# Altium schematic sheet Sensor_Section.SchDoc
size A; DocumentNumber: 9; SheetNumber: 9; SheetTotal: 13
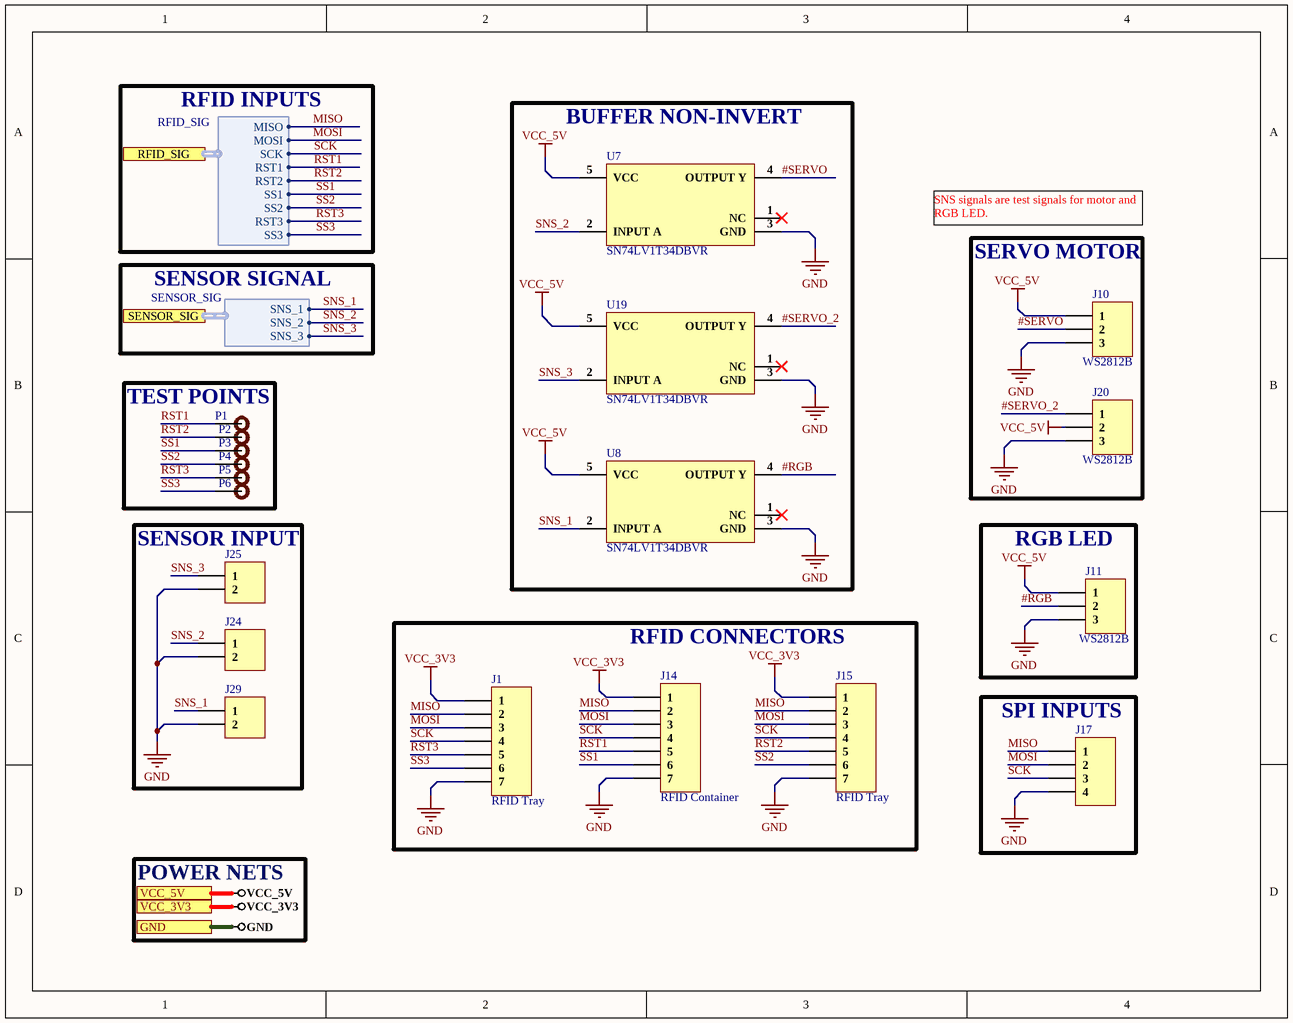
[diagram p0: Sensor_Section.SchDoc]

## Parts
J1  RFID Tray  [B7B-XH-A(LF)(SN)]
J10  WS2812B  [B3B-XH-A(LF)(SN)]
J11  WS2812B  [B3B-XH-A(LF)(SN)]
J14  RFID Container  [B7B-XH-A(LF)(SN)]
J15  RFID Tray  [B7B-XH-A(LF)(SN)]
J17  B4B-XH-A(LF)(SN)  [B4B-XH-A(LF)(SN)]  (value not drawn)
J20  WS2812B  [B3B-XH-A(LF)(SN)]
J24  B2B-XH-A(LF)(SN)  [B2B-XH-A(LF)(SN)]  (value not drawn)
J25  B2B-XH-A(LF)(SN)  [B2B-XH-A(LF)(SN)]  (value not drawn)
J29  B2B-XH-A(LF)(SN)  [B2B-XH-A(LF)(SN)]  (value not drawn)
P1  Test Point  [Test point]  (value not drawn)
P2  Test Point  [Test point]  (value not drawn)
P3  Test Point  [Test point]  (value not drawn)
P4  Test Point  [Test point]  (value not drawn)
P5  Test Point  [Test point]  (value not drawn)
P6  Test Point  [Test point]  (value not drawn)
U7  SN74LV1T34DBVR  [SOT-23-5]
U8  SN74LV1T34DBVR  [SOT-23-5]
U19  SN74LV1T34DBVR  [SOT-23-5]

## Blocks framed on the sheet
BUFFER NON-INVERT: U7 U8 U19
SERVO MOTOR: J10 J20
TEST POINTS: P1-P6
SENSOR INPUT: J24 J25 J29
RGB LED: J11
RFID CONNECTORS: J1 J14 J15
SPI INPUTS: J17

## Ports
GND, RFID_SIG (harness RFID_SIG), SENSOR_SIG (harness SENSOR_SIG), VCC_3V3, VCC_5V

## Harnesses
SENSOR_SIG: SNS_1, SNS_2, SNS_3
RFID_SIG: MOSI, SCK, RST1, MISO, RST2, SS1, SS2, SS3, RST3

## Nets
GND: J1.7 J10.3 J11.3 J14.7 J15.7 J17.4 J20.3 J24.2 J25.2 J29.2 U7.3(GND) U8.3(GND) U19.3(GND) ; port GND
VCC_3V3: J1.1 J14.1 J15.1 ; port VCC_3V3
VCC_5V: J10.1 J11.1 J20.2 U7.5(VCC) U8.5(VCC) U19.5(VCC) ; port VCC_5V
#RGB: J11.2 U8.4(OUTPUT_Y)
#SERVO: J10.2 U7.4(OUTPUT_Y)
#SERVO_2: J20.1 U19.4(OUTPUT_Y)
MISO: J1.2 J14.2 J15.2 J17.1 ; port RFID_SIG.MISO
MOSI: J1.3 J14.3 J15.3 J17.2 ; port RFID_SIG.MOSI
RST1: J14.5 P1.1 ; port RFID_SIG.RST1
RST2: J15.5 P2.1 ; port RFID_SIG.RST2
RST3: J1.5 P5.1 ; port RFID_SIG.RST3
SCK: J1.4 J14.4 J15.4 J17.3 ; port RFID_SIG.SCK
SNS_1: J29.1 U8.2(INPUT_A) ; port SENSOR_SIG.SNS_1
SNS_2: J24.1 U7.2(INPUT_A) ; port SENSOR_SIG.SNS_2
SNS_3: J25.1 U19.2(INPUT_A) ; port SENSOR_SIG.SNS_3
SS1: J14.6 P3.1 ; port RFID_SIG.SS1
SS2: J15.6 P4.1 ; port RFID_SIG.SS2
SS3: J1.6 P6.1 ; port RFID_SIG.SS3

Not connected (* = marked no-connect by the designer): U7 1(NC)*; U8 1(NC)*; U19 1(NC)*

## Notes on the sheet
- RFID INPUTS
- SNS signals are test signals for motor and RGB LED.
- SENSOR SIGNAL
- POWER NETS

## Library data of the parts
J1 J14 J15 = B7B-XH-A(LF)(SN): CONN HEADER VERT 7POS 2.5MM; Manufacturer: JST; Current Rating: 3A; Number of Positions: 7; Contact Resistance: 20mR; Voltage Rating (AC): 250V; Insulation Resistance: 1GR; Wire/Cable Gauge: 22AWG; Supplier 1: Digi-Key; Manufacturer Part Number: B7B-XH-A(LF)(SN); Stock 1: 0; Mount: Through Hole; Contact Plating: Copper,Tin,Lead; Contact Material: Brass; Color: Natural; Housing Color: White; Housing Material: Polyamide; Contact Shape: Square; Insulation Material: Nylon; Insulation Color: Natural; Contact Finish - Mating: TIN; Min Operating Temperature: -25°C; Max Operating Temperature: 85°C; Number of Rows: 1; Packaging: Bulk; Termination: Solder; Connector Type: Header; Series: XH; Contact Type: Male Pin; Voltage Rating: 250V; Max Current Rating: 3A; Fastening Type: Detent; Number of Contacts: 7; Max Voltage Rating (AC): 250V; Orientation: Straight; Length: 19.9mm; Pitch: 2.5mm; Lead Pitch: 2.5mm; Depth: 5.75mm; REACH SVHC: No SVHC; Lead Free: Lead Free; Flammability Rating: UL94 V-0; ComponentLink1URL: https://www.verical.com/server-webapp/html/getDatasheet?partID=440406&src-supplier=Verical; ComponentLink1Description: https://www.verical.com/server-webapp/html/getDatasheet?partID=440406&src-supplier=Verical; Supplier Part Number 1: 455-2252-ND
J10 J11 J20 = B3B-XH-A(LF)(SN): CONN HEADER VERT 3POS 2.5MM; Manufacturer: JST; Current Rating: 3A; Number of Positions: 3; Voltage Rating (AC): 250V; Contact Resistance: 20mR; Insulation Resistance: 1GR; Gender: Male; Wire/Cable Gauge: 22AWG; Supplier 1: Digi-Key; Manufacturer Part Number: B3B-XH-A(LF)(SN); Stock 1: 3453; Pricing 1: 1=0.19, 10=0.181, 25=0.1344, 50=0.1154, 250=0.09612, 750=0.08652, 1000=0.08075, 12000=0.06152, 24000=0.05575 (USD); Mount: Through Hole; Contact Plating: Tin,Lead,Copper; Contact Material: Brass; Color: Natural; Housing Color: White; Housing Material: Polyamide; Contact Shape: Square; Contact Finish - Mating: TIN; Insulation Material: Nylon; Insulation Color: Natural; Min Operating Temperature: -25°C; Max Operating Temperature: 85°C; Number of Rows: 1; Packaging: Bulk; Termination: Solder; Connector Type: Header; Series: XH; Contact Type: Male Pin; Max Current Rating: 3A; Voltage Rating: 250V; Fastening Type: Detent; Number of Contacts: 3; Max Voltage Rating (AC): 250V; Max Voltage Rating (DC): 250V; Orientation: Straight; Length: 9.9mm; Pitch: 2.5mm; Lead Pitch: 2.5mm; Depth: 5.75mm; Lead Free: Lead Free; REACH SVHC: No SVHC; Flammability Rating: UL94 V-0; ComponentLink1URL: https://www.verical.com/server-webapp/html/getDatasheet?partID=640434&src-supplier=Verical; ComponentLink1Description: https://www.verical.com/server-webapp/html/getDatasheet?partID=640434&src-supplier=Verical; ComponentLink2URL: https://www.verical.com/server-webapp/html/getDatasheet?partID=440399&src-supplier=Verical; ComponentLink2Description: https://www.verical.com/server-webapp/html/getDatasheet?partID=440399&src-supplier=Verical; Supplier Part Number 1: 455-2248-ND
J17 = B4B-XH-A(LF)(SN): CONN HEADER VERT 4POS 2.5MM; Manufacturer: JST; Current Rating: 3A; Contact Resistance: 20mR; Voltage Rating (AC): 250V; Number of Positions: 4; Insulation Resistance: 1GR; Connector Type: Male Pin; Gender: Male; Wire/Cable Gauge: 22AWG; Supplier 1: Digi-Key; Manufacturer Part Number: B4B-XH-A(LF)(SN); Stock 1: 0; Mount: Through Hole; Contact Material: Brass; Contact Plating: Tin,Copper,Lead; Color: Natural; Housing Color: White; Housing Material: Polyamide; Material: Polyamide; Min Operating Temperature: -25°C; Max Operating Temperature: 85°C; Number of Rows: 1; Max Current Rating: 3A; Package Quantity: 500; Packaging: Bulk; Voltage Rating: 250V; Termination: Press-Fit; Max Voltage Rating (AC): 250V; Max Voltage Rating (DC): 250V; Number of Contacts: 4; Orientation: Straight; Series: XH; Contact Type: Male Pin; Length: 12.4mm; Pitch: 2.5mm; Lead Pitch: 2.5mm; Depth: 5.75mm; REACH SVHC: No SVHC; Lead Free: Lead Free; ComponentLink1URL: http://www.jst-mfg.com/product/pdf/eng/eXH.pdf?src-supplier=Digi-Key; ComponentLink1Description: http://www.jst-mfg.com/product/pdf/eng/eXH.pdf?src-supplier=Digi-Key; ComponentLink2URL: https://www.verical.com/server-webapp/html/getDatasheet?partID=640571&src-supplier=Verical; ComponentLink2Description: https://www.verical.com/server-webapp/html/getDatasheet?partID=640571&src-supplier=Verical; ComponentLink3URL: http://www.jst-mfg.com/product/pdf/eng/eXH.pdf?src-supplier=Future+Electronics; ComponentLink3Description: http://www.jst-mfg.com/product/pdf/eng/eXH.pdf?src-supplier=Future+Electronics; ComponentLink4URL: https://www.verical.com/server-webapp/html/getDatasheet?partID=455616&src-supplier=Verical; ComponentLink4Description: https://www.verical.com/server-webapp/html/getDatasheet?partID=455616&src-supplier=Verical; Supplier Part Number 1: 455-2249-ND
J24 J25 J29 = B2B-XH-A(LF)(SN): Conn Shrouded Header (4 Sides) HDR 2 POS 2.5mm Solder ST Thru-Hole Box; Manufacturer: JST; Number of Positions: 2; Connector Type: Male Pin; Current Rating: 3A; Contact Resistance: 20mR; Voltage Rating: 250V; Insulation Resistance: 1GR; Wire/Cable Gauge: 22AWG; Supplier 1: Farnell; Manufacturer Part Number: B2B-XH-A(LF)(SN); RoHS: Yes; Category: FFC / FPC; Stock 1: 219240; Pricing 1: 100=0.06860, 1000=0.04800, 2500=0.04520, 5000=0.04230, 10000=0.03950, 20000=0.03660 (GBP); Mount: Through Hole; Contact Plating: Tin,Copper,Lead; Color: Natural; Contact Material: Brass; Housing Color: White; Housing Material: Polyamide; Min Operating Temperature: -25°C; Max Operating Temperature: 85°C; Number of Rows: 1; Packaging: Bulk; Termination: Solder; Fastening Type: Detent; Max Current Rating: 3A; Voltage Rating (AC): 250V; Max Voltage Rating (AC): 250V; Number of Contacts: 2; Max Voltage Rating (DC): 250V; Orientation: Straight; Length: 7.4mm; Pitch: 2.5mm; Lead Pitch: 2.5mm; Depth: 5.75mm; REACH SVHC: No SVHC; Lead Free: Lead Free; ComponentLink1URL: https://datasheet.ciiva.com/26894/getdatasheetpartid-640357-26894434.pdf?src-supplier=Verical; ComponentLink1Description: https://datasheet.ciiva.com/26894/getdatasheetpartid-640357-26894434.pdf?src-supplier=Verical; ComponentLink2URL: https://datasheet.ciiva.com/11746/0900766b8082653e-11746979.pdf?src-supplier=RSComponents; ComponentLink2Description: https://datasheet.ciiva.com/11746/0900766b8082653e-11746979.pdf?src-supplier=RSComponents; ComponentLink3URL: https://datasheet.ciiva.com/26894/getdatasheetpartid-385291-26894760.pdf?src-supplier=Verical; ComponentLink3Description: https://datasheet.ciiva.com/26894/getdatasheetpartid-385291-26894760.pdf?src-supplier=Verical; ComponentLink4URL: https://datasheet.ciiva.com/8052/5448-8052024.pdf?src-supplier=Element14; ComponentLink4Description: https://datasheet.ciiva.com/8052/5448-8052024.pdf?src-supplier=Element14; ComponentLink5URL: https://datasheet.ciiva.com/20207/523653-20207167.pdf?src-supplier=Rapid+Electronics; ComponentLink5Description: https://datasheet.ciiva.com/20207/523653-20207167.pdf?src-supplier=Rapid+Electronics; Supplier Part Number 1: 1516276
P1-P6 = TEST POINT: Test Point ON
U7 U8 U19 = SN74LV1T34DBVR: IC BUF NON-INVERT 5.5V SOT23-5; Manufacturer: Texas Instruments; Number of Elements: 1; Logic Function: Buffer,Inverting; High Level Output Current: -8mA; Low Level Output Current: 8mA; Min Supply Voltage: 1.6V; Polarity: Non-Inverting; Propagation Delay: 15.5ns; Quiescent Current: 1uA; Supplier 1: Digi-Key; Manufacturer Part Number: SN74LV1T34DBVR; Stock 1: 37360; Pricing 1: 1=0.43, 10=0.349, 25=0.3192, 100=0.2374, 250=0.2152, 500=0.17808, 1000=0.13356 (USD); Mount: Surface Mount; Case/Package: SOT-23-5; Number of Pins: 5; Weight: 0.000353oz; Min Operating Temperature: -40°C; Max Operating Temperature: 125°C; Packaging: Tape and Reel; Number of Bits per Element: 1; Number of Bits: 1; Package Quantity: 3000; Max Supply Voltage: 5.5V; Number of Input Lines: 1; Number of Output Lines: 1; Operating Supply Current: 8mA; Number of Channels: 1; Number of Inputs: 1; Number of Outputs: 1; Radiation Hardening: No; RoHS Compliant: Yes; REACH SVHC: No SVHC; Lead Free: Lead Free; ComponentLink1URL: http://www.ti.com/lit/pdf/sdyu001?src-supplier=Digi-Key; ComponentLink1Description: http://www.ti.com/lit/pdf/sdyu001?src-supplier=Digi-Key; ComponentLink2URL: http://www.ti.com/lit/ds/symlink/sn74lv1t34.pdf?src-supplier=Avnet; ComponentLink2Description: http://www.ti.com/lit/ds/symlink/sn74lv1t34.pdf?src-supplier=Avnet; Supplier Part Number 1: 296-37176-6-ND